# Altium project Palm_V2.0.PrjPcb (part 1 of 2)
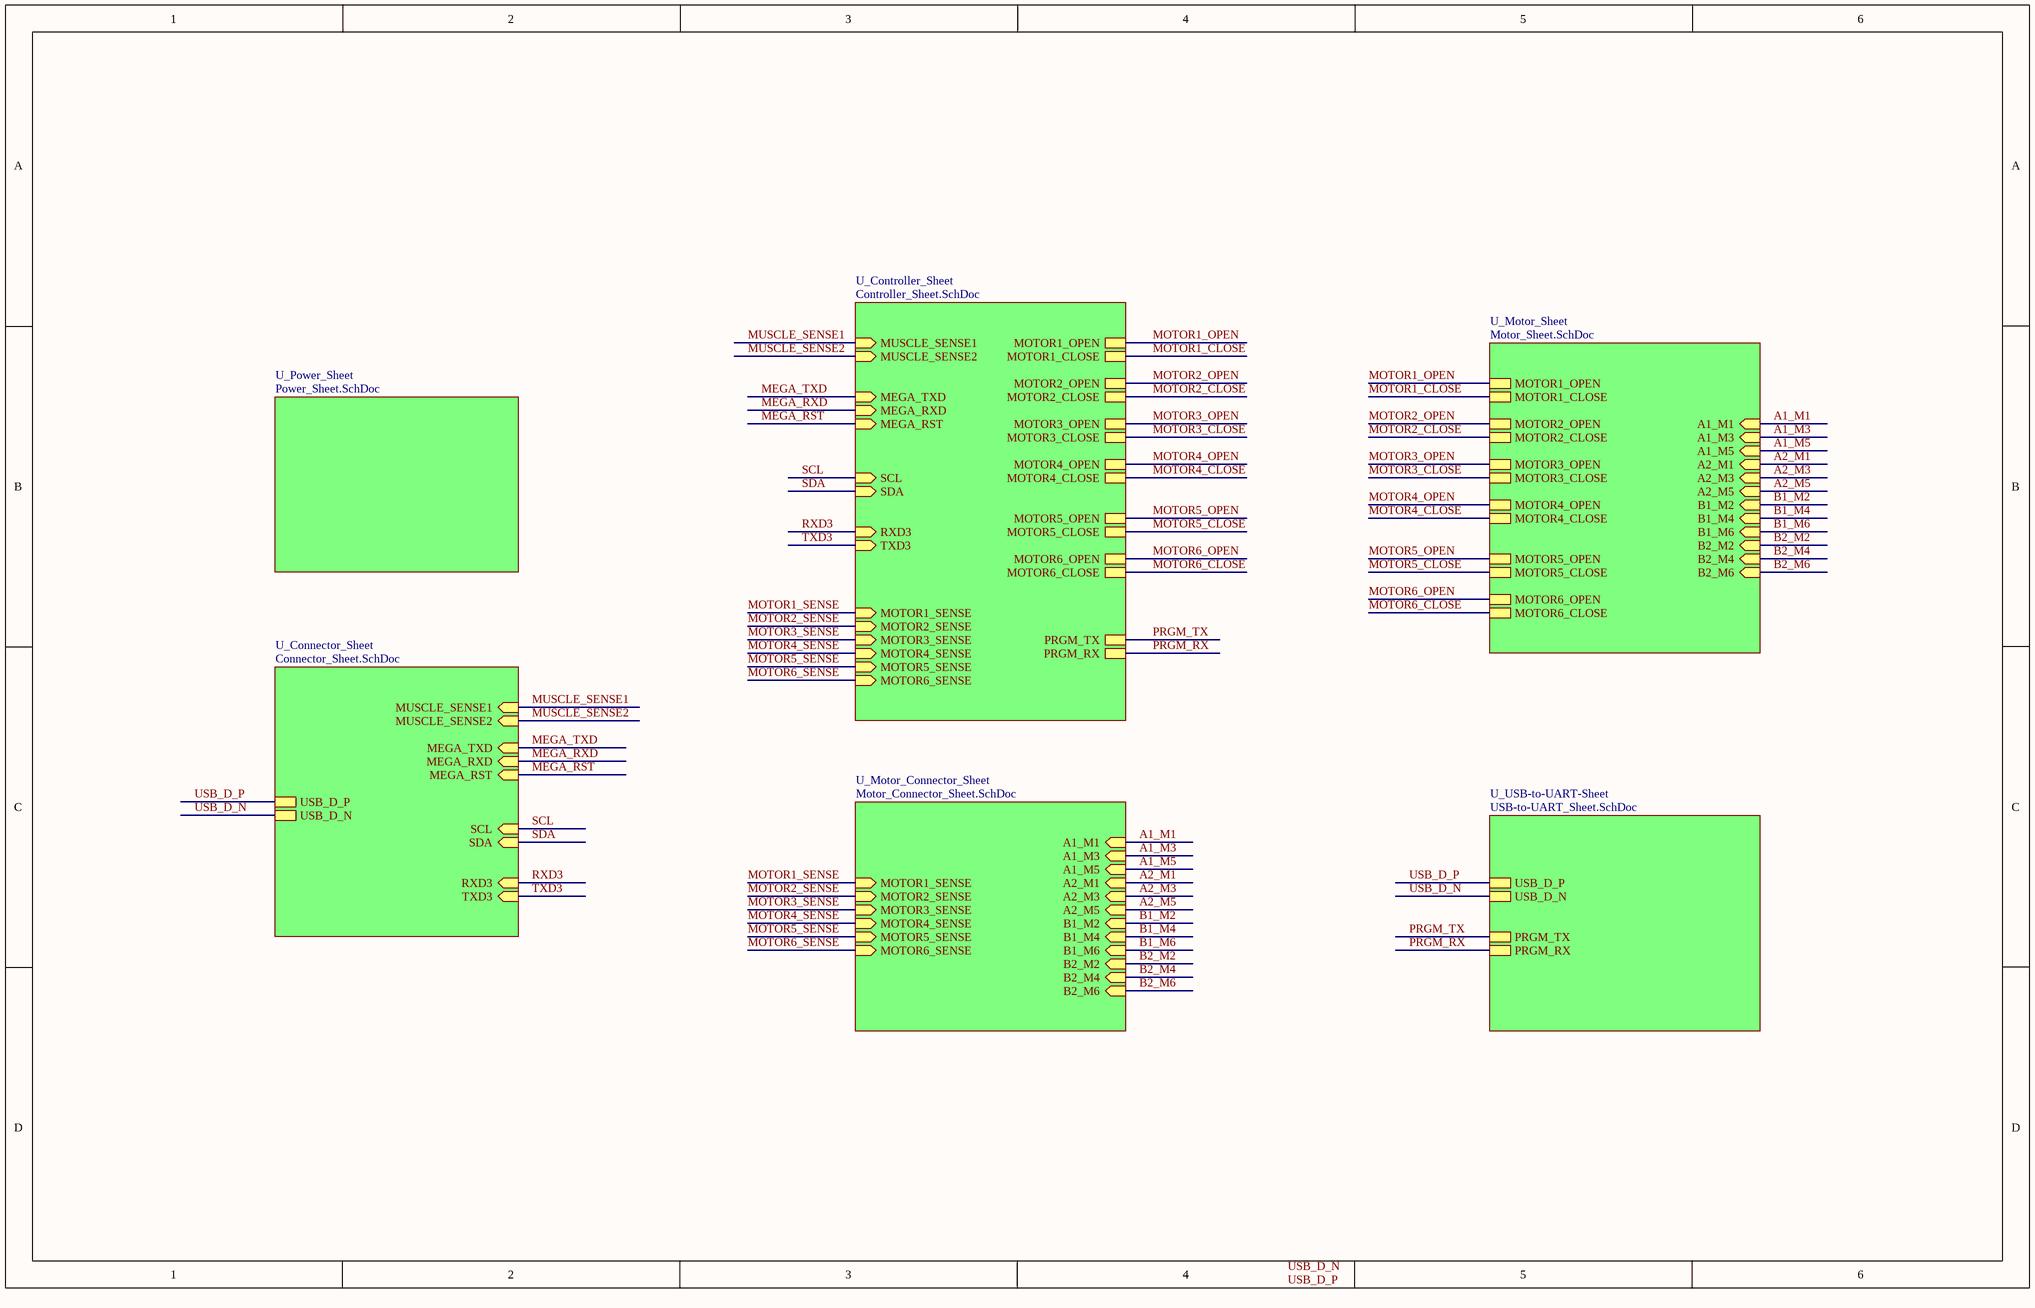
[diagram p0: Top_Sheet.SchDoc]
7 sheets, 91 parts. Net scope: hierarchical (ports join the sheet entries above them; power ports are global).
Board file: PCB_Palm_v2.0.PcbDoc
Sheets:
  Top_Sheet.SchDoc
    U_Power_Sheet = Power_Sheet.SchDoc
    U_Connector_Sheet = Connector_Sheet.SchDoc
    U_Motor_Connector_Sheet = Motor_Connector_Sheet.SchDoc
    U_Controller_Sheet = Controller_Sheet.SchDoc
    U_Motor_Sheet = Motor_Sheet.SchDoc
    U_USB-to-UART-Sheet = USB-to-UART_Sheet.SchDoc

## Sheet Top_Sheet.SchDoc
size B; DocumentNumber: 1; SheetNumber: 1; SheetTotal: 7

### Sub-sheets
U_Connector_Sheet = Connector_Sheet.SchDoc: MUSCLE_SENSE1 (in), SCL (in), SDA (in), MUSCLE_SENSE2 (in), RXD3 (in), TXD3 (in), MEGA_TXD (in), MEGA_RXD (in), MEGA_RST (in), USB_D_P, USB_D_N
U_Controller_Sheet = Controller_Sheet.SchDoc: MOTOR1_SENSE (in), MOTOR2_SENSE (in), MOTOR3_SENSE (in), MOTOR4_SENSE (in), MOTOR5_SENSE (in), MOTOR6_SENSE (in), MOTOR5_OPEN, MOTOR5_CLOSE, MOTOR6_OPEN, MOTOR6_CLOSE, MOTOR1_OPEN, MOTOR1_CLOSE, MOTOR2_OPEN, MOTOR2_CLOSE, MOTOR3_OPEN, MOTOR3_CLOSE, MOTOR4_OPEN, MOTOR4_CLOSE, SCL (in), SDA (in), RXD3 (in), TXD3 (in), MEGA_TXD (in), MEGA_RXD (in), MEGA_RST (in), MUSCLE_SENSE1 (in), MUSCLE_SENSE2 (in), PRGM_RX, PRGM_TX
U_Motor_Connector_Sheet = Motor_Connector_Sheet.SchDoc: MOTOR1_SENSE (in), MOTOR2_SENSE (in), MOTOR3_SENSE (in), MOTOR4_SENSE (in), MOTOR5_SENSE (in), MOTOR6_SENSE (in), B1_M6 (in), B2_M6 (in), A1_M5 (in), A2_M5 (in), B1_M4 (in), B2_M4 (in), A2_M3 (in), A1_M3 (in), B2_M2 (in), B1_M2 (in), A2_M1 (in), A1_M1 (in)
U_Motor_Sheet = Motor_Sheet.SchDoc: B2_M6 (in), B1_M6 (in), A2_M5 (in), A1_M5 (in), B2_M4 (in), B1_M4 (in), A2_M3 (in), A1_M3 (in), B2_M2 (in), B1_M2 (in), A2_M1 (in), A1_M1 (in), MOTOR6_CLOSE, MOTOR2_CLOSE, MOTOR2_OPEN, MOTOR4_OPEN, MOTOR5_CLOSE, MOTOR3_OPEN, MOTOR1_OPEN, MOTOR4_CLOSE, MOTOR3_CLOSE, MOTOR6_OPEN, MOTOR1_CLOSE, MOTOR5_OPEN
U_Power_Sheet = Power_Sheet.SchDoc: no entries
U_USB-to-UART-Sheet = USB-to-UART_Sheet.SchDoc: USB_D_P, USB_D_N, PRGM_RX, PRGM_TX

### Nets
A1_M1: sheet U_Motor_Connector_Sheet/A1_M1, sheet U_Motor_Sheet/A1_M1
A1_M3: sheet U_Motor_Connector_Sheet/A1_M3, sheet U_Motor_Sheet/A1_M3
A1_M5: sheet U_Motor_Connector_Sheet/A1_M5, sheet U_Motor_Sheet/A1_M5
A2_M1: sheet U_Motor_Connector_Sheet/A2_M1, sheet U_Motor_Sheet/A2_M1
A2_M3: sheet U_Motor_Connector_Sheet/A2_M3, sheet U_Motor_Sheet/A2_M3
A2_M5: sheet U_Motor_Connector_Sheet/A2_M5, sheet U_Motor_Sheet/A2_M5
B1_M2: sheet U_Motor_Connector_Sheet/B1_M2, sheet U_Motor_Sheet/B1_M2
B1_M4: sheet U_Motor_Connector_Sheet/B1_M4, sheet U_Motor_Sheet/B1_M4
B1_M6: sheet U_Motor_Connector_Sheet/B1_M6, sheet U_Motor_Sheet/B1_M6
B2_M2: sheet U_Motor_Connector_Sheet/B2_M2, sheet U_Motor_Sheet/B2_M2
B2_M4: sheet U_Motor_Connector_Sheet/B2_M4, sheet U_Motor_Sheet/B2_M4
B2_M6: sheet U_Motor_Connector_Sheet/B2_M6, sheet U_Motor_Sheet/B2_M6
MEGA_RST: sheet U_Connector_Sheet/MEGA_RST, sheet U_Controller_Sheet/MEGA_RST
MEGA_RXD: sheet U_Connector_Sheet/MEGA_RXD, sheet U_Controller_Sheet/MEGA_RXD
MEGA_TXD: sheet U_Connector_Sheet/MEGA_TXD, sheet U_Controller_Sheet/MEGA_TXD
MOTOR1_CLOSE: sheet U_Controller_Sheet/MOTOR1_CLOSE, sheet U_Motor_Sheet/MOTOR1_CLOSE
MOTOR1_OPEN: sheet U_Controller_Sheet/MOTOR1_OPEN, sheet U_Motor_Sheet/MOTOR1_OPEN
MOTOR1_SENSE: sheet U_Motor_Connector_Sheet/MOTOR1_SENSE, sheet U_Controller_Sheet/MOTOR1_SENSE
MOTOR2_CLOSE: sheet U_Controller_Sheet/MOTOR2_CLOSE, sheet U_Motor_Sheet/MOTOR2_CLOSE
MOTOR2_OPEN: sheet U_Controller_Sheet/MOTOR2_OPEN, sheet U_Motor_Sheet/MOTOR2_OPEN
MOTOR2_SENSE: sheet U_Motor_Connector_Sheet/MOTOR2_SENSE, sheet U_Controller_Sheet/MOTOR2_SENSE
MOTOR3_CLOSE: sheet U_Controller_Sheet/MOTOR3_CLOSE, sheet U_Motor_Sheet/MOTOR3_CLOSE
MOTOR3_OPEN: sheet U_Controller_Sheet/MOTOR3_OPEN, sheet U_Motor_Sheet/MOTOR3_OPEN
MOTOR3_SENSE: sheet U_Motor_Connector_Sheet/MOTOR3_SENSE, sheet U_Controller_Sheet/MOTOR3_SENSE
MOTOR4_CLOSE: sheet U_Controller_Sheet/MOTOR4_CLOSE, sheet U_Motor_Sheet/MOTOR4_CLOSE
MOTOR4_OPEN: sheet U_Controller_Sheet/MOTOR4_OPEN, sheet U_Motor_Sheet/MOTOR4_OPEN
MOTOR4_SENSE: sheet U_Motor_Connector_Sheet/MOTOR4_SENSE, sheet U_Controller_Sheet/MOTOR4_SENSE
MOTOR5_CLOSE: sheet U_Controller_Sheet/MOTOR5_CLOSE, sheet U_Motor_Sheet/MOTOR5_CLOSE
MOTOR5_OPEN: sheet U_Controller_Sheet/MOTOR5_OPEN, sheet U_Motor_Sheet/MOTOR5_OPEN
MOTOR5_SENSE: sheet U_Motor_Connector_Sheet/MOTOR5_SENSE, sheet U_Controller_Sheet/MOTOR5_SENSE
MOTOR6_CLOSE: sheet U_Controller_Sheet/MOTOR6_CLOSE, sheet U_Motor_Sheet/MOTOR6_CLOSE
MOTOR6_OPEN: sheet U_Controller_Sheet/MOTOR6_OPEN, sheet U_Motor_Sheet/MOTOR6_OPEN
MOTOR6_SENSE: sheet U_Motor_Connector_Sheet/MOTOR6_SENSE, sheet U_Controller_Sheet/MOTOR6_SENSE
MUSCLE_SENSE1: sheet U_Connector_Sheet/MUSCLE_SENSE1, sheet U_Controller_Sheet/MUSCLE_SENSE1
MUSCLE_SENSE2: sheet U_Connector_Sheet/MUSCLE_SENSE2, sheet U_Controller_Sheet/MUSCLE_SENSE2
PRGM_RX: sheet U_Controller_Sheet/PRGM_RX, sheet U_USB-to-UART-Sheet/PRGM_RX
PRGM_TX: sheet U_Controller_Sheet/PRGM_TX, sheet U_USB-to-UART-Sheet/PRGM_TX
RXD3: sheet U_Connector_Sheet/RXD3, sheet U_Controller_Sheet/RXD3
SCL: sheet U_Connector_Sheet/SCL, sheet U_Controller_Sheet/SCL
SDA: sheet U_Connector_Sheet/SDA, sheet U_Controller_Sheet/SDA
TXD3: sheet U_Connector_Sheet/TXD3, sheet U_Controller_Sheet/TXD3
USB_D_N: sheet U_Connector_Sheet/USB_D_N, sheet U_USB-to-UART-Sheet/USB_D_N
USB_D_P: sheet U_Connector_Sheet/USB_D_P, sheet U_USB-to-UART-Sheet/USB_D_P

### Notes on the sheet
- Labels drawn without touching a wire or pin: USB_D_N, USB_D_P

## Sheet Power_Sheet.SchDoc
size A; DocumentNumber: 2; SheetNumber: 2; SheetTotal: 7
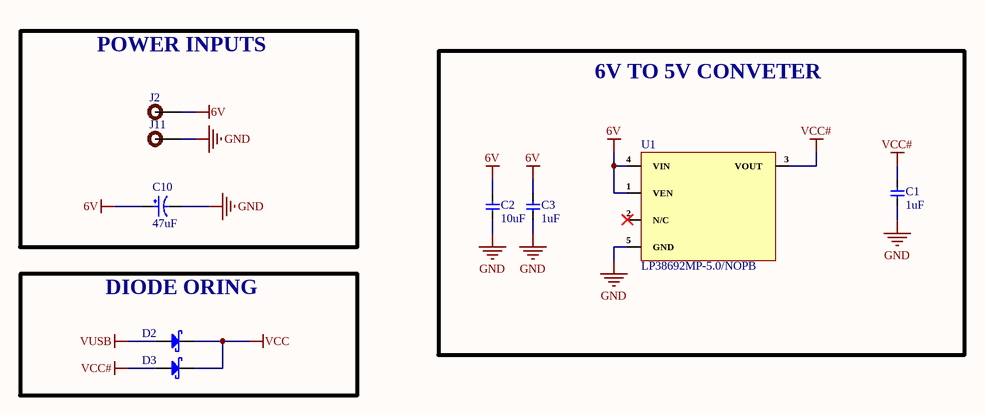
[diagram p1: Power_Sheet.SchDoc]

### Parts
C1  1uF  [Cap-0402]
C2  10uF  [Cap-0402]
C3  1uF  [Cap-0402]
C10  47uF  [Case-D]
D2  SS54B-HF  [SMB_]  (value not drawn)
D3  SS54B-HF  [SMB_]  (value not drawn)
J2  Test Point -TH 1.8mm Hole size 0.92mm  [Test Point -TH 1.8mm Hole size 0.92mm]  (value not drawn)  (no BOM)
J11  Test Point -TH 1.8mm Hole size 0.92mm  [Test Point -TH 1.8mm Hole size 0.92mm]  (value not drawn)  (no BOM)
U1  LP38692MP-5.0/NOPB  [SOT-223-5]

### Blocks framed on the sheet
POWER INPUTS: C10 J2 J11
6V TO 5V CONVETER: C1-C3 U1
DIODE ORING: D2 D3

### Nets
6V: C2.2 C3.2 C10.1 J2.1 U1.1(VEN) U1.4(VIN)
GND: C1.1 C2.1 C3.1 C10.2 J11.1 U1.5(GND)
VCC: D2.2(K) D3.2(K)
VCC#: C1.2 D3.1(A) U1.3(VOUT)
VUSB: D2.1(A)

Not connected (* = marked no-connect by the designer): U1 2(N/C)*

### Library data of the parts
C1 C3 = CC0402KRX5R6BB105: CAP CER 1UF 10V X5R 0402; Manufacturer: Yageo; Tolerance: 10%; Dissipation Factor: 15%; Item Type: Capacitor; Supplier 1: Mouser; Manufacturer Part Number: CC0402KRX5R6BB105; RoHS: Yes; Category: Ceramic Capacitors; Stock 1: 6711367; Pricing 1: 1=0.11000, 10=0.05500, 50=0.05500, 100=0.03300, 500=0.02700, 1000=0.02200, 2500=0.02100, 10000=0.01800 (USD); Mount: Surface Mount; Case/Package: 0402; Number of Pins: 2; Case Code (Metric): 1005; Case Code (Imperial): 0402; Min Operating Temperature: -55°C; Max Operating Temperature: 85°C; Capacitance: 1uF; Dielectric: X5R; Package Quantity: 1; Voltage Rating: 10V; Packaging: Tape and Reel; Voltage Rating (DC): 10V; Termination: SMD/SMT; Resistor Type: Ceramic; Series: CC; Construction: Flat; Length: 1mm; Width: 0.02inch; Height: 0.5mm; Thickness: 0.022inch; Depth: 0.5mm; Radiation Hardening: No; REACH SVHC: No SVHC; Lead Free: Lead Free; Halogen Free: Halogen Free; RoHS Compliant: Yes; ComponentLink1URL: https://datasheet.ciiva.com/176/upy-gphc-x5r-4v-to-50v-12-176704.pdf?src-supplier=Digi-Key; ComponentLink1Description: https://datasheet.ciiva.com/176/upy-gphc-x5r-4v-to-50v-12-176704.pdf?src-supplier=Digi-Key; ComponentLink2URL: https://datasheet.ciiva.com/176/mlccorderingcode-176705.pdf?src-supplier=Digi-Key; ComponentLink2Description: https://datasheet.ciiva.com/176/mlccorderingcode-176705.pdf?src-supplier=Digi-Key; ComponentLink3URL: https://datasheet.ciiva.com/176/mlccorderingcode-176706.pdf?src-supplier=Digi-Key; ComponentLink3Description: https://datasheet.ciiva.com/176/mlccorderingcode-176706.pdf?src-supplier=Digi-Key; Supplier Part Number 1: 603-CC402KRX5R6BB105; LCSC Part Number: C106254
C2 = CC0402MRX5R6BB106: CAP CER 10UF 10V X5R 0402; Manufacturer: Yageo; Tolerance: 20%; Item Type: Capacitor; Supplier 1: Future Electronics; Manufacturer Part Number: CC0402MRX5R6BB106; RoHS: Yes; Category: Ceramic Capacitors; Stock 1: 80000; Pricing 1: 10000=0.02650, 20000=0.02590, 30000=0.02550, 40000=0.02530, 50000=0.02450 (USD); Mount: Surface Mount; Case/Package: 0402; Case Code (Imperial): 0402; Case Code (Metric): 1005; Min Operating Temperature: -55°C; Max Operating Temperature: 85°C; Packaging: Tape and Reel; Capacitance: 10uF; Voltage Rating: 10V; RoHS Compliant: Yes; ComponentLink1URL: http://www.yageo.com/documents/recent/UPY-GPHC_X5R_4V-to-50V_25.pdf?src-supplier=Digi-Key; ComponentLink1Description: http://www.yageo.com/documents/recent/UPY-GPHC_X5R_4V-to-50V_25.pdf?src-supplier=Digi-Key; Supplier Part Number 1: 6097631; LCSC Part Number: C962143
C10 = CA45-D025K476T: 47uF 25V 0.9Ω@100kHz ±10% CASE-D-7343 Tantalum Capacitors ROHS; Manufacturer: Hunan Xiangyee in S&T; Manufacturer Part Number: CA45-D025K476T; ComponentLink1URL: https://www.lcsc.com/product-detail/Tantalum-Capacitors_Hunan-Xiangyee-in-S-T-CA45-D025K476T_C123267.html; ComponentLink1Description: LCSC; LCSC Part Number: C123267; Item Type: Capacitor; Package: CASE-D-7343
D2 D3 = SS54B-HF: DIODE SCHOTTKY 5A 40V SMB; Manufacturer: Comchip; Supplier 1: Mouser; Manufacturer Part Number: SS54B-HF; RoHS: No; Stock 1: 2862; Pricing 1: 1=0.56000, 10=0.32900, 50=0.32900, 100=0.17100, 1000=0.11900, 10000=0.09000 (USD); Supplier Part Number 1: 750-SS54B-HF; LCSC Part Number: C3759253
U1 = LP38692MP-5.0/NOPB: IC REG LINEAR 5V 1A SOT223-5; Manufacturer: Texas Instruments; Item Type: LDO; Supplier: Mouser; Supplier Part Number: 926-38692MP-5.0/NOPB; Manufacturer Part Number: LP38692MP-5.0/NOPB; RoHS: Yes; Stock: 1461; Pricing: 1=2.01, 10=1.71, 50=1.71, 100=1.45, 1000=0.91, 10000=0.888 (USD); Thickness: 1.6mm; ComponentLink1URL: https://datasheet.ciiva.com/6596/lp38690-6596184.pdf?src-supplier=Digikey; ComponentLink1Description: https://datasheet.ciiva.com/6596/lp38690-6596184.pdf?src-supplier=Digikey; ComponentLink2URL: https://datasheet.ciiva.com/6596/lp38690-6596185.pdf?src-supplier=Digikey; ComponentLink2Description: https://datasheet.ciiva.com/6596/lp38690-6596185.pdf?src-supplier=Digikey; ComponentLink3URL: https://datasheet.ciiva.com/6596/lp38690-6596186.pdf?src-supplier=Digikey; ComponentLink3Description: https://datasheet.ciiva.com/6596/lp38690-6596186.pdf?src-supplier=Digikey; ComponentLink4URL: https://datasheet.ciiva.com/14278/lp38692-14278796.pdf?src-supplier=Avnet; ComponentLink4Description: https://datasheet.ciiva.com/14278/lp38692-14278796.pdf?src-supplier=Avnet; ComponentLink5URL: https://datasheet.ciiva.com/22704/1854710-22704677.pdf?src-supplier=Element14; ComponentLink5Description: https://datasheet.ciiva.com/22704/1854710-22704677.pdf?src-supplier=Element14; LCSC Part Number: C28191

## Sheet Connector_Sheet.SchDoc
size A; DocumentNumber: 6; SheetNumber: 7; SheetTotal: 7
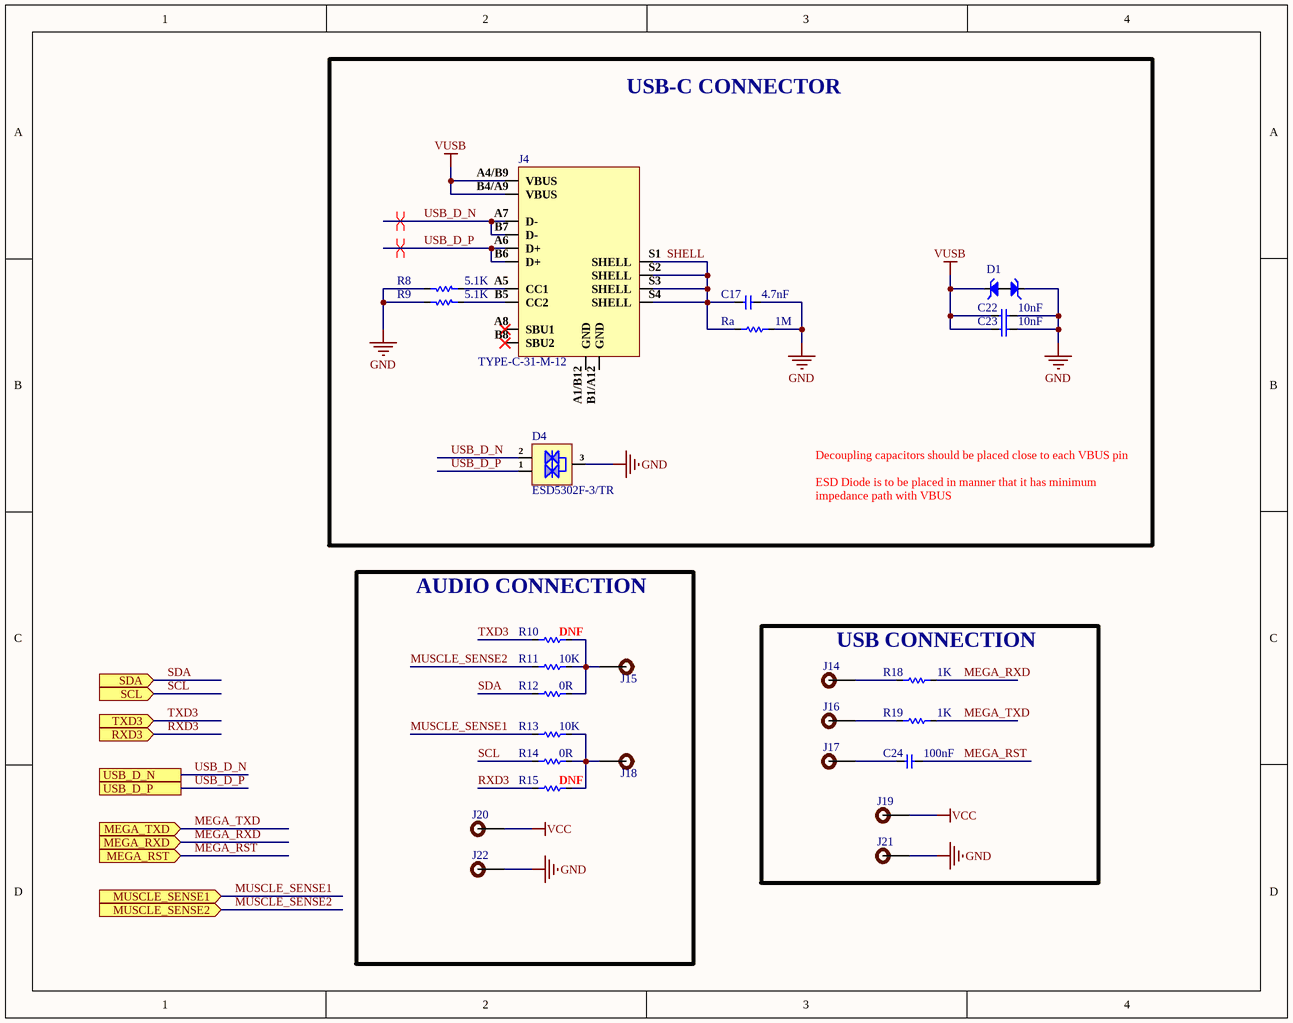
[diagram p2: Connector_Sheet.SchDoc]

### Parts
C17  4.7nF  [Cap-1206]
C22  10nF  [Cap-0402]
C23  10nF  [Cap-0402]
C24  100nF  [Cap-0402]
D1  PESD5V0H1BSFYL  [DSN0603-2]  (value not drawn)
D4  ESD5302F-3/TR  [Sot-23]
J4  TYPE-C-31-M-12  [TYPE-C-31-M-12_]
J14  Test Point -TH 1.8mm Hole size 0.92mm  [Test Point -TH 1.8mm Hole size 0.92mm]  (value not drawn)  (no BOM)
J15  Test Point -TH 1.8mm Hole size 0.92mm  [Test Point -TH 1.8mm Hole size 0.92mm]  (value not drawn)  (no BOM)
J16  Test Point -TH 1.8mm Hole size 0.92mm  [Test Point -TH 1.8mm Hole size 0.92mm]  (value not drawn)  (no BOM)
J17  Test Point -TH 1.8mm Hole size 0.92mm  [Test Point -TH 1.8mm Hole size 0.92mm]  (value not drawn)  (no BOM)
J18  Test Point -TH 1.8mm Hole size 0.92mm  [Test Point -TH 1.8mm Hole size 0.92mm]  (value not drawn)  (no BOM)
J19  Test Point -TH 1.8mm Hole size 0.92mm  [Test Point -TH 1.8mm Hole size 0.92mm]  (value not drawn)  (no BOM)
J20  Test Point -TH 1.8mm Hole size 0.92mm  [Test Point -TH 1.8mm Hole size 0.92mm]  (value not drawn)  (no BOM)
J21  Test Point -TH 1.8mm Hole size 0.92mm  [Test Point -TH 1.8mm Hole size 0.92mm]  (value not drawn)  (no BOM)
J22  Test Point -TH 1.8mm Hole size 0.92mm  [Test Point -TH 1.8mm Hole size 0.92mm]  (value not drawn)  (no BOM)
R8  5.1K  [Res-0402]
R9  5.1K  [Res-0402]
R10  DNF  [Res-0402]
R11  10K  [Res-0402]
R12  0R  [Res-0402]
R13  10K  [Res-0402]
R14  0R  [Res-0402]
R15  DNF  [Res-0402]
R18  1K  [Res-0402]
R19  1K  [Res-0402]
Ra  1M  [Res-0603]

### Blocks framed on the sheet
USB-C CONNECTOR: C17 C22 C23 D1 D4 J4 R8 R9 Ra
AUDIO CONNECTION: J15 J18 J20 J22 R10-R15
USB CONNECTION: C24 J14 J16 J17 J19 J21 R18 R19

### Ports
MEGA_RST (in), MEGA_RXD (in), MEGA_TXD (in), MUSCLE_SENSE1 (in), MUSCLE_SENSE2 (in), RXD3 (in), SCL (in), SDA (in), TXD3 (in), USB_D_N, USB_D_P

### Nets
GND: C17.1 C22.2 C23.2 D1.2 D4.3(GND) J21.1 J22.1 R8.2 R9.2 Ra.1
VCC: J19.1 J20.1
VUSB: C22.1 C23.1 D1.1 J4.A4/B9(VBUS) J4.B4/A9(VBUS)
MEGA_RST: C24.2 ; port MEGA_RST
MEGA_RXD: R18.1 ; port MEGA_RXD
MEGA_TXD: R19.1 ; port MEGA_TXD
MUSCLE_SENSE1: R13.1 ; port MUSCLE_SENSE1
MUSCLE_SENSE2: R11.1 ; port MUSCLE_SENSE2
RXD3: R15.1 ; port RXD3
SCL: R14.1 ; port SCL
SDA: R12.1 ; port SDA
SHELL: C17.2 J4.S1(SHELL) J4.S2(SHELL) J4.S3(SHELL) J4.S4(SHELL) Ra.2
TXD3: R10.1 ; port TXD3
USB_D_N: D4.2(I/O2) J4.A7(D-) J4.B7(D-) ; port USB_D_N
USB_D_P: D4.1(I/O1) J4.A6(D+) J4.B6(D+) ; port USB_D_P
NetC24_1: C24.1 J17.1
NetJ4_A5: J4.A5(CC1) R8.1
NetJ4_B5: J4.B5(CC2) R9.1
NetJ14_1: J14.1 R18.2
NetJ15_1: J15.1 R10.2 R11.2 R12.2
NetJ16_1: J16.1 R19.2
NetJ18_1: J18.1 R13.2 R14.2 R15.2

Not connected (* = marked no-connect by the designer): J4 A1/B12(GND) A8(SBU1)* B1/A12(GND) B8(SBU2)*

### Layout directives
differential pair; net class USB; differential pair class USB_Lines; rule Impedance Constraint [Min = 85.00    Max = 90.00    ]; rule Matched Net Lengths [Tolerance = 50mil]: USB_D_N, USB_D_P

### Notes on the sheet
- Decoupling capacitors should be placed close to each VBUS pin
- ESD Diode is to be placed in manner that it has minimum impedance path with VBUS

### Library data of the parts
C17 = CC1206KKX7RCBB472: CAP CER 4700PF 1KV X7R 1206; Manufacturer: Yageo; Dielectric Material: Ceramic; Tolerance: 10%; Item Type: Capacitor; Supplier 1: Future Electronics; Manufacturer Part Number: CC1206KKX7RCBB472; RoHS: Yes; Category: Ceramic Capacitors; Stock 1: 180000; Pricing 1: 3000=0.02860, 9000=0.02750, 15000=0.02700, 45000=0.02600, 75000=0.02510 (USD); Mount: Surface Mount; Case/Package: 1206; Number of Pins: 2; Case Code (Imperial): 1206; Case Code (Metric): 3216; Weight: 0.000571oz; Min Operating Temperature: -55°C; Max Operating Temperature: 125°C; Voltage Rating: 1kV; Capacitance: 4.7nF; Packaging: Tape and Reel; Voltage Rating (DC): 1kV; Dielectric: X7R; Termination: SMD/SMT; Resistor Type: Ceramic; Series: CC; Length: 3.2mm; Width: 0.063inch; Thickness: 0.057inch; Depth: 1.6mm; Radiation Hardening: No; Lead Free: Lead Free; RoHS Compliant: Yes; ComponentLink1URL: https://datasheet.ciiva.com/13208/upy-gp-np0-16v-to-50v-8-13208693.pdf?src-supplier=Mouser; ComponentLink1Description: https://datasheet.ciiva.com/13208/upy-gp-np0-16v-to-50v-8-13208693.pdf?src-supplier=Mouser; ComponentLink2URL: https://datasheet.ciiva.com/11466/hv-11466701.pdf?src-supplier=Avnet; ComponentLink2Description: https://datasheet.ciiva.com/11466/hv-11466701.pdf?src-supplier=Avnet; Supplier Part Number 1: 7130131; LCSC Part Number: C107198
C22 C23 = CC0402KRX7R8BB103: CAP CER 10000PF 25V X7R 0402; Manufacturer: Yageo; Tolerance: 10%; Item Type: Capacitor; Supplier 1: Digi-Key; Manufacturer Part Number: CC0402KRX7R8BB103; Stock 1: 0; Pricing 1: 1=0.1, 10=0.021, 100=0.0093, 500=0.00666, 1000=0.00523, 2500=0.00476, 5000=0.00438 (USD); Mount: Surface Mount; Case/Package: 0402; Case Code (Metric): 1005; Case Code (Imperial): 0402; Min Operating Temperature: -55°C; Max Operating Temperature: 125°C; Capacitance: 10nF; Dielectric: X7R; Voltage Rating: 25V; Package Quantity: 1; Packaging: Tape and Reel; Voltage Rating (DC): 25V; Termination: SMD/SMT; Composition: Ceramic; Length: 1mm; Height: 0.5mm; Depth: 0.5mm; Width: 0.02inch; Thickness: 0.022inch; Radiation Hardening: No; REACH SVHC: Unknown; Lead Free: Lead Free; Halogen Free: Halogen Free; ComponentLink1URL: http://www.yageo.com/documents/recent/UPY-GPHC_X7R_6.3V-to-50V_18.pdf?src-supplier=Digi-Key; ComponentLink1Description: http://www.yageo.com/documents/recent/UPY-GPHC_X7R_6.3V-to-50V_18.pdf?src-supplier=Digi-Key; ComponentLink2URL: https://www.verical.com/server-webapp/html/getDatasheet?partID=375418&src-supplier=Verical; ComponentLink2Description: https://www.verical.com/server-webapp/html/getDatasheet?partID=375418&src-supplier=Verical; ComponentLink3URL: http://www.yageo.com/documents/recent/UPY-GPHC_X7R_6.3V-to-50V_8.pdf?src-supplier=Avnet; ComponentLink3Description: http://www.yageo.com/documents/recent/UPY-GPHC_X7R_6.3V-to-50V_8.pdf?src-supplier=Avnet; ComponentLink4URL: https://4donline.ihs.com/images/VipMasterIC/IC/YAGO/YAGO-S-A0003557223/YAGO-S-A0003557223-1.pdf?hkey=52A5661711E402568146F3353EA87419&src-supplier=Element14; ComponentLink4Description: https://4donline.ihs.com/images/VipMasterIC/IC/YAGO/YAGO-S-A0003557223/YAGO-S-A0003557223-1.pdf?hkey=52A5661711E402568146F3353EA87419&src-supplier=Element14; ComponentLink5URL: http://www.farnell.com/datasheets/2167236.pdf?src-supplier=Element14; ComponentLink5Description: http://www.farnell.com/datasheets/2167236.pdf?src-supplier=Element14; ComponentLink6URL: http://www.mouser.com/ds/2/447/Yageo_UPY-GP_NP0_16V-to-50V_9-358835.pdf?src-supplier=Mouser; ComponentLink6Description: http://www.mouser.com/ds/2/447/Yageo_UPY-GP_NP0_16V-to-50V_9-358835.pdf?src-supplier=Mouser; Supplier Part Number 1: 311-1337-1-ND; LCSC Part Number: C327025
C24 = CC0402KRX5R8BB104: CAP CER 0.1UF 25V X5R 0402; Manufacturer: Yageo; Tolerance: 10%; Item Type: Capacitor; Supplier 1: Digi-Key; Manufacturer Part Number: CC0402KRX5R8BB104; RoHS: Yes; Category: Ceramic Capacitors; Stock 1: 4598218; Pricing 1: 1=0.10000, 10=0.03800, 50=0.02100, 100=0.01710, 500=0.01224, 1000=0.00961, 2500=0.00874, 5000=0.00804 (USD); Mount: Surface Mount; Case/Package: 0402; Case Code (Metric): 1005; Case Code (Imperial): 0402; Min Operating Temperature: -55°C; Max Operating Temperature: 85°C; Voltage Rating: 25V; Packaging: Tape and Reel; Capacitance: 100nF; Voltage Rating (DC): 25V; Dielectric: X5R; Resistor Type: Ceramic; Series: CC; Length: 0.039inch; Width: 0.02inch; Thickness: 0.022inch; Depth: 0.5mm; Lead Free: Lead Free; Halogen Free: Halogen Free; RoHS Compliant: Yes; ComponentLink1URL: http://www.mouser.com/ds/2/447/UPY-GPHC_X5R_4V-to-50V_25-1131599.pdf?src-supplier=Mouser; ComponentLink1Description: http://www.mouser.com/ds/2/447/UPY-GPHC_X5R_4V-to-50V_25-1131599.pdf?src-supplier=Mouser; ComponentLink2URL: http://www.yageo.com/documents/recent/UPY-GPHC_X5R_4V-to-50V-16.pdf?src-supplier=Future+Electronics; ComponentLink2Description: http://www.yageo.com/documents/recent/UPY-GPHC_X5R_4V-to-50V-16.pdf?src-supplier=Future+Electronics; ComponentLink3URL: http://www.yageo.com/documents/recent/UPY-GPHC_X5R_4V-to-50V_25.pdf?src-supplier=Digi-Key; ComponentLink3Description: http://www.yageo.com/documents/recent/UPY-GPHC_X5R_4V-to-50V_25.pdf?src-supplier=Digi-Key; Supplier Part Number 1: 311-1697-1-ND; LCSC Part Number: C106256
D1 = PESD5V0H1BSFYL: TVS DIODE 5VWM 6.3VC DSN0603-2; Manufacturer: Nexperia; Supplier 1: Avnet; Manufacturer Part Number: PESD5V0H1BSFYL; RoHS: Yes; Category: ESD and Circuit Protection ICs; Stock 1: 9000; Pricing 1: 18000=0.06453, 36000=0.06278, 54000=0.06104, 90000=0.05930, 180000=0.05755, 900000=0.05581, 1800000=0.05406 (USD); RoHS Compliant: Yes; ComponentLink1URL: http://www.farnell.com/datasheets/1961312.pdf?src-supplier=Farnell; ComponentLink1Description: http://www.farnell.com/datasheets/1961312.pdf?src-supplier=Farnell; ComponentLink2URL: https://assets.nexperia.com/documents/data-sheet/PESD5V0H1BSF.pdf?src-supplier=Digi-Key; ComponentLink2Description: https://assets.nexperia.com/documents/data-sheet/PESD5V0H1BSF.pdf?src-supplier=Digi-Key; ComponentLink3URL: http://www.farnell.com/datasheets/1961312.pdf?src-supplier=Newark; ComponentLink3Description: http://www.farnell.com/datasheets/1961312.pdf?src-supplier=Newark; Supplier Part Number 1: PESD5V0H1BSFYL; LCSC Part Number: C477989; Item Type: Diode
D4 = ESD5302F-3/TR: 16A 20V 7V 5V@Max Unidirectional SOT-23 TVS ROHS; Manufacturer: WILLSEMI; Item Type: Diode; Manufacturer Part Number: ESD5302F-3/TR; Package: SOT-23; LCSC Part Number: C239643; ComponentLink1Description: LCSC; ComponentLink1URL: https://www.lcsc.com/product-detail/TVS_WILLSEMI-Will-Semicon-ESD5302F-3-TR_C239643.html
J4 = TYPE-C-31-M-12: 5A 1 16P Female Type-C SMD USB Connectors ROHS; Manufacturer: Korean Hroparts Elec; ComponentLink1Description: LCSC; ComponentLink1URL: https://www.lcsc.com/product-detail/USB-Connectors_Korean-Hroparts-Elec-TYPE-C-31-M-12_C165948.html; Manufacturer Part Number: TYPE-C-31-M-12; Footprint: Custom; LCSC Part Number: C165948; Item Type: USB Connector
R8 R9 = RC0402FR-075K1L: RES 5.1K OHM 1% 1/16W 0402; Manufacturer: Yageo; Power Rating: 63mW; Resistance: 5.1kR; Temperature Coefficient: 100ppm/°C; Voltage Rating: 50V; Item Type: Resistor; Supplier 1: Avnet; Manufacturer Part Number: RC0402FR-075K1L; RoHS: Yes; Category: Chip SMD Resistors; Stock 1: 65000; Pricing 1: 10000=0.00085 (USD); Case/Package: 0402; Case Code (Metric): 1005; Case Code (Imperial): 0402; Min Operating Temperature: -55°C; Max Operating Temperature: 155°C; Tolerance: 1%; Technology: THICK FILM; Packaging: Tape and Reel; Package Quantity: 1; Resistor Type: Thick Film; Number of Terminations: 2; Termination: SMD/SMT; Max Power Dissipation: 63mW; Voltage Rating (DC): 50V; Working Voltage: 50V; Features: Moisture Resistant; Series: RC; Resistance Tolerance: 1%; Construction: Rectangular; Length: 1mm; Width: 0.02inch; Height: 0.016inch; Depth: 0.5mm; RoHS Compliant: Yes; Military Standard: Not; Lead Free: Lead Free; ComponentLink1URL: https://datasheet.ciiva.com/7983/1018594-7983519.pdf?src-supplier=Element14; ComponentLink1Description: https://datasheet.ciiva.com/7983/1018594-7983519.pdf?src-supplier=Element14; ComponentLink2URL: https://datasheet.ciiva.com/46394/1018594-46394936.pdf?src-supplier=Element14; ComponentLink2Description: https://datasheet.ciiva.com/46394/1018594-46394936.pdf?src-supplier=Element14; ComponentLink3URL: https://datasheet.ciiva.com/2453/pyu-r-int-thick-7-2453401.pdf?src-supplier=Digi-Key; ComponentLink3Description: https://datasheet.ciiva.com/2453/pyu-r-int-thick-7-2453401.pdf?src-supplier=Digi-Key; ComponentLink4URL: https://datasheet.ciiva.com/2453/pyu-r-int-thick-7-2453402.pdf?src-supplier=Digi-Key; ComponentLink4Description: https://datasheet.ciiva.com/2453/pyu-r-int-thick-7-2453402.pdf?src-supplier=Digi-Key; ComponentLink5URL: https://datasheet.ciiva.com/2453/pyu-r-int-thick-7-2453400.pdf?src-supplier=Digi-Key; ComponentLink5Description: https://datasheet.ciiva.com/2453/pyu-r-int-thick-7-2453400.pdf?src-supplier=Digi-Key; ComponentLink6URL: https://datasheet.ciiva.com/12558/pyu-rc0402-51-rohs-l-6-r-8721-12558460.pdf?src-supplier=Mouser; ComponentLink6Description: https://datasheet.ciiva.com/12558/pyu-rc0402-51-rohs-l-6-r-8721-12558460.pdf?src-supplier=Mouser; ComponentLink7URL: https://datasheet.ciiva.com/16744/pyu-rc0402-51-rohs-l-6-r-16744283.pdf?src-supplier=Future+Electronics; ComponentLink7Description: https://datasheet.ciiva.com/16744/pyu-rc0402-51-rohs-l-6-r-16744283.pdf?src-supplier=Future+Electronics; ComponentLink8URL: https://datasheet.ciiva.com/15189/getdatasheetpartid-323636-15189493.pdf?src-supplier=Verical; ComponentLink8Description: https://datasheet.ciiva.com/15189/getdatasheetpartid-323636-15189493.pdf?src-supplier=Verical; Supplier Part Number 1: RC0402FR-075K1L; LCSC Part Number: C105872
R10 R11 R13 R15 = RC0402FR-0710KL: RES 10K OHM 1% 1/16W 0402; Manufacturer: Yageo; Resistance: 10kR; Voltage Rating (DC): 50V; Temperature Coefficient: 100ppm/°C; Power Rating: 62.5mW; Max Power Dissipation: 63mW; Item Type: Resistor; Supplier 1: Mouser; Manufacturer Part Number: RC0402FR-0710KL; RoHS: Yes; Category: Chip SMD Resistors; Stock 1: 18648329; Pricing 1: 1=0.10000, 10=0.01400, 50=0.01400, 100=0.00500, 1000=0.00300, 10000=0.00200 (USD); Case/Package: 0402; Number of Pins: 2; Case Code (Imperial): 0402; Case Code (Metric): 1005; Min Operating Temperature: -55°C; Max Operating Temperature: 155°C; Resistor Type: Thick Film; Tolerance: 1%; Packaging: Tape and Reel; Voltage Rating: 50V; Termination: SMD/SMT; Working Voltage: 50V; Number of Terminations: 2; Features: Moisture Resistant; Series: RC; Resistance Tolerance: 1%; Construction: Rectangular; Length: 1mm; Width: 0.5mm; Height: 0.32mm; Depth: 0.5mm; Lead Pitch: 0.2mm; REACH SVHC: No SVHC; Lead Free: Lead Free; RoHS Compliant: Yes; Military Standard: Not; ComponentLink1URL: https://datasheet.ciiva.com/7660/38568-7660787.pdf?src-supplier=Element14; ComponentLink1Description: https://datasheet.ciiva.com/7660/38568-7660787.pdf?src-supplier=Element14; ComponentLink2URL: https://datasheet.ciiva.com/7849/1686128-7849814.pdf?src-supplier=Element14; ComponentLink2Description: https://datasheet.ciiva.com/7849/1686128-7849814.pdf?src-supplier=Element14; ComponentLink3URL: https://datasheet.ciiva.com/7983/1018594-7983486.pdf?src-supplier=Element14; ComponentLink3Description: https://datasheet.ciiva.com/7983/1018594-7983486.pdf?src-supplier=Element14; ComponentLink4URL: https://datasheet.ciiva.com/22747/1018594-22747512.pdf?src-supplier=Element14; ComponentLink4Description: https://datasheet.ciiva.com/22747/1018594-22747512.pdf?src-supplier=Element14; ComponentLink5URL: https://datasheet.ciiva.com/12667/pyu-rc0402-51-rohs-l-6-r-12667067.pdf?src-supplier=Mouser; ComponentLink5Description: https://datasheet.ciiva.com/12667/pyu-rc0402-51-rohs-l-6-r-12667067.pdf?src-supplier=Mouser; ComponentLink6URL: https://datasheet.ciiva.com/7849/1784430-7849813.pdf?src-supplier=Element14; ComponentLink6Description: https://datasheet.ciiva.com/7849/1784430-7849813.pdf?src-supplier=Element14; ComponentLink7URL: https://datasheet.ciiva.com/7849/1784430-7849815.pdf?src-supplier=Element14; ComponentLink7Description: https://datasheet.ciiva.com/7849/1784430-7849815.pdf?src-supplier=Element14; Supplier Part Number 1: 603-RC0402FR-0710KL; LCSC Part Number: C60490
R12 R14 = RC0402FR-070RL: RES 0 OHM JUMPER 1/16W 0402; Manufacturer: Yageo; Item Type: Resistors; Tolerance: 1%; Power Rating: 62.5mW; Voltage Rating: 50V; Temperature Coefficient: 200ppm/°C; Max Power Dissipation: 63mW; Supplier 1: Mouser; Manufacturer Part Number: RC0402FR-070RL; RoHS: Yes; Stock 1: 8556842; Pricing 1: 1=0.10000, 10=0.01400, 50=0.01400, 100=0.00600, 1000=0.00300, 5000=0.00200, 10000=0.00100 (USD); Mount: Surface Mount; Case/Package: 0402; Contact Plating: Tin,Matte; Case Code (Imperial): 0402; Case Code (Metric): 1005; Size Code: 0402; Min Operating Temperature: -55°C; Max Operating Temperature: 155°C; Resistance: 0R; Resistor Type: Thick Film; Packaging: Tape and Reel; Termination: SMD/SMT; Features: Moisture Resistant; Series: RC; Number of Terminations: 2; Length: 1mm; Width: 0.5mm; Height: 0.35mm; Radiation Hardening: No; Lead Free: Lead Free; RoHS Compliant: Yes; ComponentLink1URL: https://datasheet.ciiva.com/8896/pyu-rc0402-51-rohs-l-6-8896149.pdf?src-supplier=Avnet; ComponentLink1Description: https://datasheet.ciiva.com/8896/pyu-rc0402-51-rohs-l-6-8896149.pdf?src-supplier=Avnet; ComponentLink2URL: https://datasheet.ciiva.com/16790/pyu-rc0402-51-rohs-l-6-r-16790444.pdf?src-supplier=Future+Electronics; ComponentLink2Description: https://datasheet.ciiva.com/16790/pyu-rc0402-51-rohs-l-6-r-16790444.pdf?src-supplier=Future+Electronics; Supplier Part Number 1: 603-RC0402FR-070RL; LCSC Part Number: C106231
R18 R19 = RC0402JR-071KL: RES 1K OHM 5% 1/16W 0402; Manufacturer: Yageo; Resistance: 1kR; Power Rating: 62.5mW; Voltage Rating: 50V; Temperature Coefficient: 100ppm/°C; Max Power Dissipation: 63mW; Item Type: Resistor; Supplier 1: Digi-Key; Manufacturer Part Number: RC0402JR-071KL; RoHS: Yes; Category: Chip SMD Resistors; Stock 1: 452315; Pricing 1: 1=0.10000, 10=0.01300, 100=0.00540, 1000=0.00244, 2500=0.00212, 5000=0.00175 (USD); Case/Package: 0402; Case Code (Imperial): 0402; Case Code (Metric): 1005; Size Code: 0402; Min Operating Temperature: -55°C; Max Operating Temperature: 155°C; Tolerance: 5%; Packaging: Tape and Reel; Package Quantity: 1; Termination: SMD/SMT; Resistor Type: Thick Film; Number of Terminations: 2; Features: Moisture Resistant; Series: RC; Resistance Tolerance: 5%; Construction: Rectangular; Length: 0.039inch; Width: 0.02inch; Height: 0.016inch; Depth: 0.5mm; REACH SVHC: No SVHC; Military Standard: Not; Lead Free: Lead Free; RoHS Compliant: Yes; ComponentLink1URL: https://datasheet.ciiva.com/7983/1018594-7983558.pdf?src-supplier=Element14; ComponentLink1Description: https://datasheet.ciiva.com/7983/1018594-7983558.pdf?src-supplier=Element14; ComponentLink2URL: https://datasheet.ciiva.com/2452/pyu-r-int-thick-7-2452756.pdf?src-supplier=Digi-Key; ComponentLink2Description: https://datasheet.ciiva.com/2452/pyu-r-int-thick-7-2452756.pdf?src-supplier=Digi-Key; ComponentLink3URL: https://datasheet.ciiva.com/2452/pyu-r-int-thick-7-2452757.pdf?src-supplier=Digi-Key; ComponentLink3Description: https://datasheet.ciiva.com/2452/pyu-r-int-thick-7-2452757.pdf?src-supplier=Digi-Key; ComponentLink4URL: https://datasheet.ciiva.com/2452/pyu-r-int-thick-7-2452755.pdf?src-supplier=Digi-Key; ComponentLink4Description: https://datasheet.ciiva.com/2452/pyu-r-int-thick-7-2452755.pdf?src-supplier=Digi-Key; ComponentLink5URL: https://datasheet.ciiva.com/7850/1018594-7850170.pdf?src-supplier=Element14; ComponentLink5Description: https://datasheet.ciiva.com/7850/1018594-7850170.pdf?src-supplier=Element14; ComponentLink6URL: https://datasheet.ciiva.com/7850/1018594-7850171.pdf?src-supplier=Element14; ComponentLink6Description: https://datasheet.ciiva.com/7850/1018594-7850171.pdf?src-supplier=Element14; ComponentLink7URL: https://datasheet.ciiva.com/17081/pyu-rc0402-51-rohs-l-6-r-17081438.pdf?src-supplier=Future+Electronics; ComponentLink7Description: https://datasheet.ciiva.com/17081/pyu-rc0402-51-rohs-l-6-r-17081438.pdf?src-supplier=Future+Electronics; Supplier Part Number 1: 311-1.0KJRCT-ND; LCSC Part Number: C105637
Ra = RC0603FR-071ML: RES SMD 1M OHM 1% 1/10W 0603; Manufacturer: Yageo; Voltage Rating: 50V; Resistance: 1MR; Power Rating: 100mW; Temperature Coefficient: 100ppm/°C; Item Type: Resistor; Supplier 1: Digi-Key; Manufacturer Part Number: RC0603FR-071ML; Stock 1: 3824601; Pricing 1: 1=0.1, 10=0.023, 100=0.0094, 1000=0.00421, 2500=0.00366 (USD); Case/Package: 0603; Number of Pins: 2; Case Code (Imperial): 0603; Case Code (Metric): 1608; Min Operating Temperature: -55°C; Max Operating Temperature: 155°C; Voltage Rating (DC): 50V; Tolerance: 1%; Packaging: Tape and Reel; Package Quantity: 5000; Termination: SMD/SMT; Composition: Thick Film; Military Standard: Not; Length: 1.6mm; Height: 0.45mm; Width: 0.8mm; Depth: 0.8mm; REACH SVHC: No SVHC; Lead Free: Lead Free; ComponentLink1URL: http://www.farnell.com/datasheets/2167052.pdf?src-supplier=Mouser; ComponentLink1Description: http://www.farnell.com/datasheets/2167052.pdf?src-supplier=Mouser; ComponentLink2URL: http://www.farnell.com/datasheets/2167052.pdf?src-supplier=Element14; ComponentLink2Description: http://www.farnell.com/datasheets/2167052.pdf?src-supplier=Element14; ComponentLink3URL: http://documents.rs-components.com/techlib://itc_doclist_GB.htm?stockno=5048956&src-supplier=RSComponents; ComponentLink3Description: http://documents.rs-components.com/techlib://itc_doclist_GB.htm?stockno=5048956&src-supplier=RSComponents; Supplier Part Number 1: 311-1.00MHRDKR-ND; LCSC Part Number: C105578

## Sheet Motor_Connector_Sheet.SchDoc
size A; DocumentNumber: 5; SheetNumber: 5; SheetTotal: 7
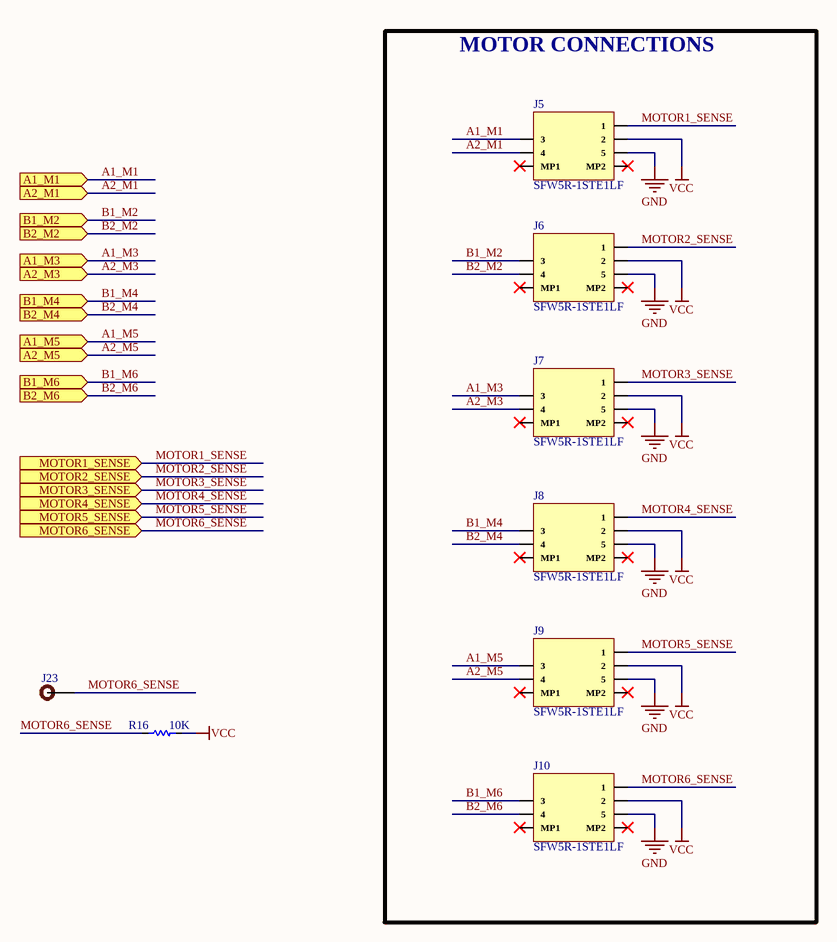
[diagram p3: Motor_Connector_Sheet.SchDoc]

### Parts
J5  SFW5R-1STE1LF  [SFW5R-1STE1LF]
J6  SFW5R-1STE1LF  [SFW5R-1STE1LF]
J7  SFW5R-1STE1LF  [SFW5R-1STE1LF]
J8  SFW5R-1STE1LF  [SFW5R-1STE1LF]
J9  SFW5R-1STE1LF  [SFW5R-1STE1LF]
J10  SFW5R-1STE1LF  [SFW5R-1STE1LF]
J23  Test Point -TH 1.8mm Hole size 0.92mm  [Test Point -TH 1.8mm Hole size 0.92mm]  (value not drawn)  (no BOM)
R16  10K  [Res-0402]

### Blocks framed on the sheet
MOTOR CONNECTIONS: J5-J10

### Ports
A1_M1 (in), A1_M3 (in), A1_M5 (in), A2_M1 (in), A2_M3 (in), A2_M5 (in), B1_M2 (in), B1_M4 (in), B1_M6 (in), B2_M2 (in), B2_M4 (in), B2_M6 (in), MOTOR1_SENSE (in), MOTOR2_SENSE (in), MOTOR3_SENSE (in), MOTOR4_SENSE (in), MOTOR5_SENSE (in), MOTOR6_SENSE (in)

### Nets
GND: J5.5 J6.5 J7.5 J8.5 J9.5 J10.5
VCC: J5.2 J6.2 J7.2 J8.2 J9.2 J10.2 R16.2
A1_M1: J5.3 ; port A1_M1
A1_M3: J7.3 ; port A1_M3
A1_M5: J9.3 ; port A1_M5
A2_M1: J5.4 ; port A2_M1
A2_M3: J7.4 ; port A2_M3
A2_M5: J9.4 ; port A2_M5
B1_M2: J6.3 ; port B1_M2
B1_M4: J8.3 ; port B1_M4
B1_M6: J10.3 ; port B1_M6
B2_M2: J6.4 ; port B2_M2
B2_M4: J8.4 ; port B2_M4
B2_M6: J10.4 ; port B2_M6
MOTOR1_SENSE: J5.1 ; port MOTOR1_SENSE
MOTOR2_SENSE: J6.1 ; port MOTOR2_SENSE
MOTOR3_SENSE: J7.1 ; port MOTOR3_SENSE
MOTOR4_SENSE: J8.1 ; port MOTOR4_SENSE
MOTOR5_SENSE: J9.1 ; port MOTOR5_SENSE
MOTOR6_SENSE: J10.1 J23.1 R16.1 ; port MOTOR6_SENSE

Not connected (* = marked no-connect by the designer): J5 MP1* MP2*; J6 MP1* MP2*; J7 MP1* MP2*; J8 MP1* MP2*; J9 MP1* MP2*; J10 MP1* MP2*

### Library data of the parts
J5-J10 = SFW5R-1STE1LF: CONN FFC FPC BOTTOM 5POS 1MM R/A; Manufacturer: Amphenol ICC / FCI; Item Type: FFC / FPC; Supplier: Avnet; Supplier Part Number: 62K5638; Manufacturer Part Number: SFW5R-1STE1LF; RoHS: Yes; Stock: 33; Pricing: 1=0.257 (USD); ComponentLink1URL: https://datasheet.ciiva.com/5137/sfw12lf-5137830.pdf?src-supplier=Mouser; ComponentLink1Description: https://datasheet.ciiva.com/5137/sfw12lf-5137830.pdf?src-supplier=Mouser; ComponentLink2URL: https://datasheet.ciiva.com/8038/sfw12lf-8038169.pdf?src-supplier=Element14; ComponentLink2Description: https://datasheet.ciiva.com/8038/sfw12lf-8038169.pdf?src-supplier=Element14; ComponentLink3URL: https://datasheet.ciiva.com/10369/sfw12lf-10369098.pdf?src-supplier=Avnet; ComponentLink3Description: https://datasheet.ciiva.com/10369/sfw12lf-10369098.pdf?src-supplier=Avnet; ComponentLink4URL: https://datasheet.ciiva.com/670/sfw12lf-670021.pdf?src-supplier=Digikey; ComponentLink4Description: https://datasheet.ciiva.com/670/sfw12lf-670021.pdf?src-supplier=Digikey; ComponentLink5URL: https://datasheet.ciiva.com/670/sfw12lf-670022.pdf?src-supplier=Digikey; ComponentLink5Description: https://datasheet.ciiva.com/670/sfw12lf-670022.pdf?src-supplier=Digikey; ComponentLink6URL: https://datasheet.ciiva.com/670/sfw12lf-670023.pdf?src-supplier=Digikey; ComponentLink6Description: https://datasheet.ciiva.com/670/sfw12lf-670023.pdf?src-supplier=Digikey
R16 = RC0402FR-0710KL: as R10 on sheet Connector_Sheet; Supplier 1: Mouser; Manufacturer Part Number: RC0402FR-0710KL; RoHS: Yes; Category: Chip SMD Resistors; Stock 1: 18648329; Pricing 1: 1=0.10000, 10=0.01400, 50=0.01400, 100=0.00500, 1000=0.00300, 10000=0.00200 (USD); Case/Package: 0402; Number of Pins: 2; Case Code (Imperial): 0402; Case Code (Metric): 1005; Min Operating Temperature: -55°C; Max Operating Temperature: 155°C; Resistor Type: Thick Film; Tolerance: 1%; Packaging: Tape and Reel; Voltage Rating: 50V; Termination: SMD/SMT; Working Voltage: 50V; Number of Terminations: 2; Features: Moisture Resistant; Series: RC; Resistance Tolerance: 1%; Construction: Rectangular; Length: 1mm; Width: 0.5mm; Height: 0.32mm; Depth: 0.5mm; Lead Pitch: 0.2mm; REACH SVHC: No SVHC; Lead Free: Lead Free; RoHS Compliant: Yes; Military Standard: Not; ComponentLink1URL: https://datasheet.ciiva.com/7660/38568-7660787.pdf?src-supplier=Element14; ComponentLink1Description: https://datasheet.ciiva.com/7660/38568-7660787.pdf?src-supplier=Element14; ComponentLink2URL: https://datasheet.ciiva.com/7849/1686128-7849814.pdf?src-supplier=Element14; ComponentLink2Description: https://datasheet.ciiva.com/7849/1686128-7849814.pdf?src-supplier=Element14; ComponentLink3URL: https://datasheet.ciiva.com/7983/1018594-7983486.pdf?src-supplier=Element14; ComponentLink3Description: https://datasheet.ciiva.com/7983/1018594-7983486.pdf?src-supplier=Element14; ComponentLink4URL: https://datasheet.ciiva.com/22747/1018594-22747512.pdf?src-supplier=Element14; ComponentLink4Description: https://datasheet.ciiva.com/22747/1018594-22747512.pdf?src-supplier=Element14; ComponentLink5URL: https://datasheet.ciiva.com/12667/pyu-rc0402-51-rohs-l-6-r-12667067.pdf?src-supplier=Mouser; ComponentLink5Description: https://datasheet.ciiva.com/12667/pyu-rc0402-51-rohs-l-6-r-12667067.pdf?src-supplier=Mouser; ComponentLink6URL: https://datasheet.ciiva.com/7849/1784430-7849813.pdf?src-supplier=Element14; ComponentLink6Description: https://datasheet.ciiva.com/7849/1784430-7849813.pdf?src-supplier=Element14; ComponentLink7URL: https://datasheet.ciiva.com/7849/1784430-7849815.pdf?src-supplier=Element14; ComponentLink7Description: https://datasheet.ciiva.com/7849/1784430-7849815.pdf?src-supplier=Element14; Supplier Part Number 1: 603-RC0402FR-0710KL; LCSC Part Number: C60490